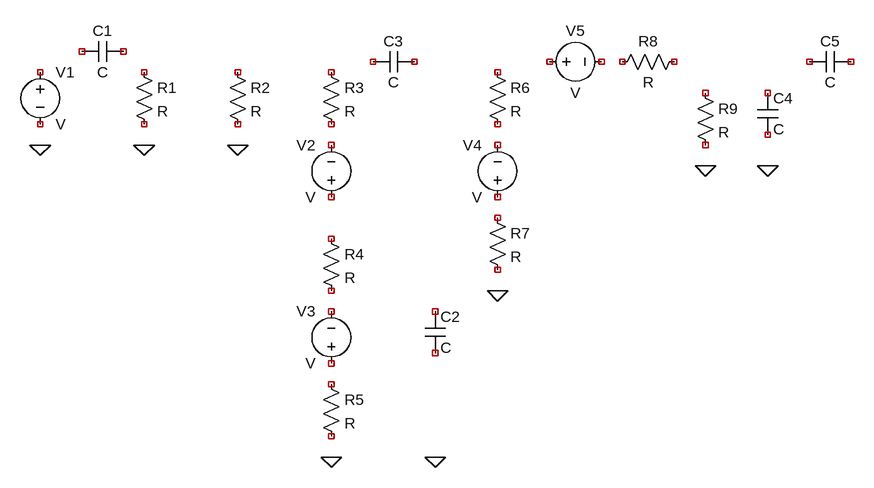
[diagram p0: schematic AmpliCompleto.asc]
AmpliCompleto.asc, the LTspice schematic file:
Version 4.1
SHEET 1 1288 724
FLAG 32 224 0
FLAG 192 224 0
FLAG 336 224 0
FLAG 480 704 0
FLAG 640 704 0
FLAG 736 448 0
FLAG 1056 256 0
FLAG 1152 256 0
SYMBOL voltage 32 96 R0
SYMATTR InstName V1
SYMBOL cap 160 64 R90
WINDOW 0 0 32 VBottom 2
WINDOW 3 32 32 VTop 2
SYMATTR InstName C1
SYMBOL res 176 96 R0
SYMATTR InstName R1
SYMBOL res 320 96 R0
SYMATTR InstName R2
SYMBOL res 464 96 R0
SYMATTR InstName R3
SYMBOL voltage 480 320 R180
WINDOW 0 24 96 Left 2
WINDOW 3 24 16 Left 2
SYMATTR InstName V2
SYMBOL res 464 352 R0
SYMATTR InstName R4
SYMBOL voltage 480 576 R180
WINDOW 0 24 96 Left 2
WINDOW 3 24 16 Left 2
SYMATTR InstName V3
SYMBOL res 464 576 R0
SYMATTR InstName R5
SYMBOL cap 624 480 R0
SYMATTR InstName C2
SYMBOL cap 608 80 R90
WINDOW 0 0 32 VBottom 2
WINDOW 3 32 32 VTop 2
SYMATTR InstName C3
SYMBOL res 720 96 R0
SYMATTR InstName R6
SYMBOL voltage 736 320 R180
WINDOW 0 24 96 Left 2
WINDOW 3 24 16 Left 2
SYMATTR InstName V4
SYMBOL res 720 320 R0
SYMATTR InstName R7
SYMBOL voltage 800 96 R270
WINDOW 0 32 56 VTop 2
WINDOW 3 -32 56 VBottom 2
SYMATTR InstName V5
SYMBOL res 1024 80 R90
WINDOW 0 0 56 VBottom 2
WINDOW 3 32 56 VTop 2
SYMATTR InstName R8
SYMBOL res 1040 128 R0
SYMATTR InstName R9
SYMBOL cap 1136 144 R0
SYMATTR InstName C4
SYMBOL cap 1280 80 R90
WINDOW 0 0 32 VBottom 2
WINDOW 3 32 32 VTop 2
SYMATTR InstName C5

The netlist it stands for:
* AmpliCompleto.asc
V1 NC_01 NC_02 V
C1 NC_03 NC_04 C
R1 NC_05 NC_06 R
R2 NC_07 NC_08 R
R3 NC_09 NC_10 R
V2 NC_11 NC_12 V
R4 NC_13 NC_14 R
V3 NC_15 NC_16 V
R5 NC_17 NC_18 R
C2 NC_19 NC_20 C
C3 NC_21 NC_22 C
R6 NC_23 NC_24 R
V4 NC_25 NC_26 V
R7 NC_27 NC_28 R
V5 NC_29 NC_30 V
R8 NC_31 NC_32 R
R9 NC_33 NC_34 R
C4 NC_35 NC_36 C
C5 NC_37 NC_38 C
.backanno
.end